# Altium schematic sheet 2.Microcontroller-NRF9160.SchDoc
size A2; DocumentNumber: 2; SheetNumber: 2
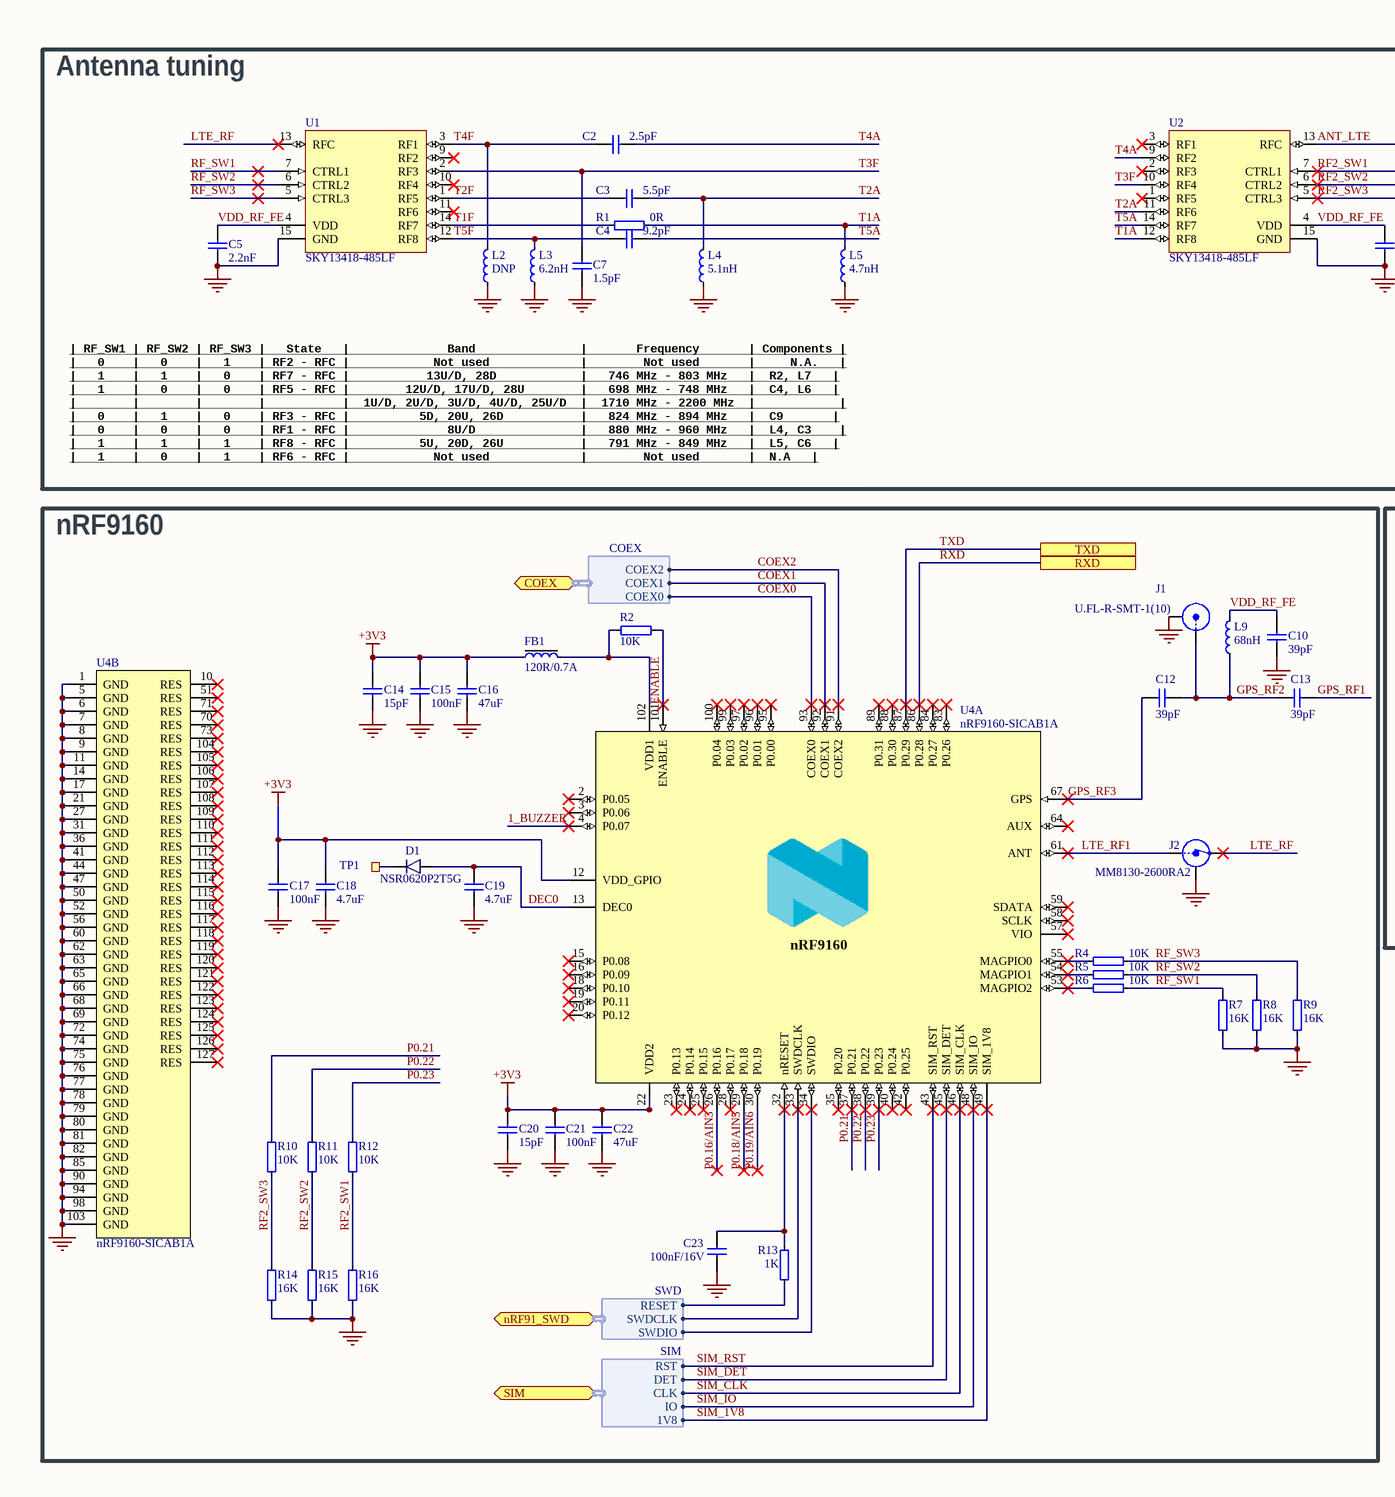
[diagram p0: 2.Microcontroller-NRF9160.SchDoc, left]
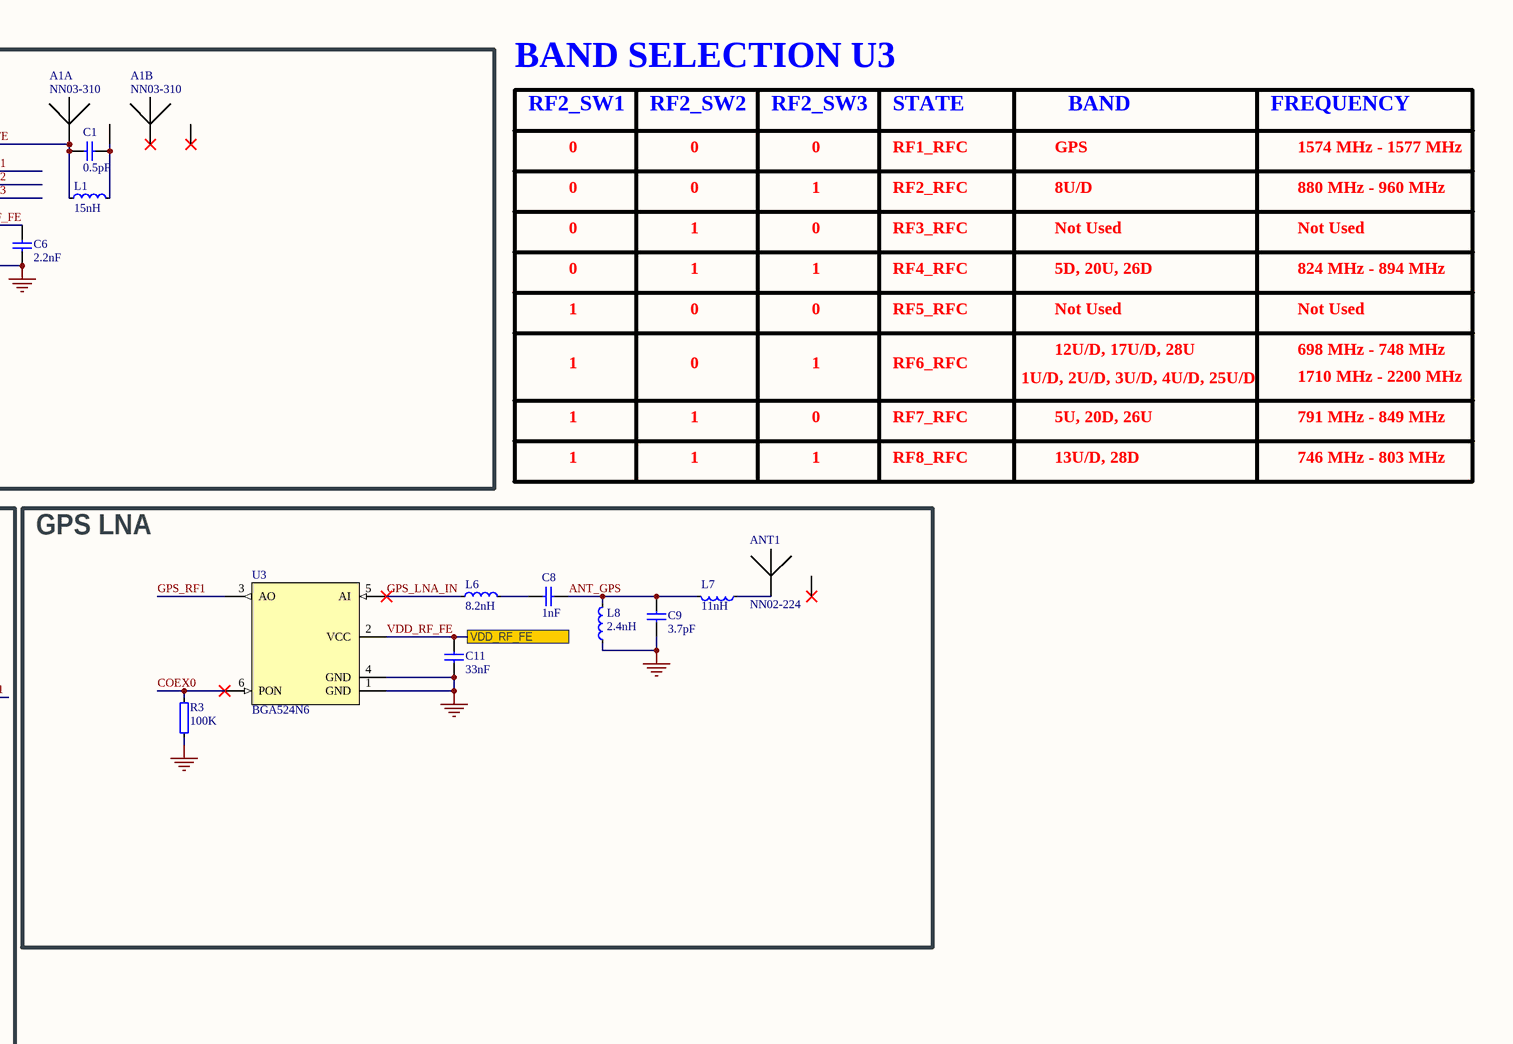
[diagram p1: 2.Microcontroller-NRF9160.SchDoc, right]

## Parts
A1  NN03-310  [FR01-S4-210_DF]  (parts A,B of 2)
ANT1  NN02-224  [ANT-NN02-224]
C1  0.5pF  [CAPC1005X04L]
C2  2.5pF  [CAPC0603X03L_C]
C3  5.5pF  [CAPC0603X03L_C]
C4  9.2pF  [CAPC0603X03L_C]
C5  2.2nF  [CAPC1005X04L]
C6  2.2nF  [CAPC1005X04L]
C7  1.5pF  [CAPC0603X03L_C]
C8  1nF  [CAPC1005X04L]
C9  3.7pF  [CAPC1005X04L]
C10  39pF  [CAPC1608X06L_3]
C11  33nF  [CAPC1005X04L]
C12  39pF  [CAPC1608X06L_3]
C13  39pF  [CAPC1608X06L_3]
C14  15pF  [CAPC1608X06L_3]
C15  100nF  [CAPC1608X06L_3]
C16  47uF  [CAPC2012X11L]
C17  100nF  [CAPC1608X06L_3]
C18  4.7uF  [CAPC1608X06L_3]
C19  4.7uF  [CAPC1608X06L_3]
C20  15pF  [CAPC1608X06L_3]
C21  100nF  [CAPC1608X06L_3]
C22  47uF  [CAPC2012X11L]
C23  100nF/16V  [CAPC1005X04L]
D1  NSR0620P2T5G  [SODFL100X40-2N]
FB1  120R/0.7A  [INDC1005X04L]
J1  U.FL-R-SMT-1(10)  [COAXIAL RF U.FL-R-SMT-1]
J2  MM8130-2600RA2  [COAXIAL-SWF]
L1  15nH  [INDC1608X06L_WW]
L2  DNP  [INDC0603X03L_C]
L3  6.2nH  [INDC0603X03L_C]
L4  5.1nH  [INDC0603X03L_C]
L5  4.7nH  [INDC0603X03L_C]
L6  8.2nH  [INDC1608X06L_WW]
L7  11nH  [INDC1608X06L]
L8  2.4nH  [INDC1005X04L_2]
L9  68nH  [INDC1005X04L_WW]
R1  0R  [RESC0603X03L_C]
R2  10K  [RESC1005X04L]
R3  100K  [RESC1005X04L]
R4  10K  [RESC1005X04L]
R5  10K  [RESC1005X04L]
R6  10K  [RESC1005X04L]
R7  16K  [RESC1005X04L]
R8  16K  [RESC1005X04L]
R9  16K  [RESC1005X04L]
R10  10K  [RESC1005X04L]
R11  10K  [RESC1005X04L]
R12  10K  [RESC1005X04L]
R13  1K  [RESC1005X04L]
R14  16K  [RESC1005X04L]
R15  16K  [RESC1005X04L]
R16  16K  [RESC1005X04L]
TP1  Ø1.0mm,SMD  [TP_SMD_Ø1.0mm]  (value not drawn)  (no BOM)
U1  SKY13418-485LF  [UFQFN40P200X200X65_HS-15N]
U2  SKY13418-485LF  [UFQFN40P200X200X65_HS-15N]
U3  BGA524N6  [XFDFN40P100X55-6N]
U4  nRF9160-SICAB1A  [LGA50P1600X1050X104-161N]  (parts A,B of 2)

## Blocks framed on the sheet
Antenna tuning: A1 C1-C7 L1-L5 R1 U1 U2
nRF9160: C10 C12-C23 D1 FB1 J1 J2 L9 R2 R4-R16 TP1 U4
GPS LNA: ANT1 C8 C9 C11 L6-L8 R3 U3

## Ports
COEX (bidir, harness COEX), nRF91_SWD (bidir, harness SWD), RXD, SIM (bidir, harness SIM), TXD, VDD_RF_FE

## Harnesses
SWD: SWDIO, SWDCLK, RESET
SIM: DET, RST, CLK, IO, 1V8
COEX: COEX2, COEX1, COEX0

## Nets
+3V3: C14.1 C15.1 C16.1 C17.1 C18.1 C20.1 C21.1 C22.1 FB1.1 U4.12(VDD_GPIO) U4.22(VDD2)
GND: C5.2 C6.2 C7.2 C9.2 C10.1 C11.1 C14.2 C15.2 C16.2 C17.2 C18.2 C19.2 C20.2 C21.2 C22.2 C23.2 J1.2(Y) J2.2(Shield) L2.1 L3.1 L4.1 L5.1 L8.1 R3.1 R7.1 R8.1 R9.1 R14.1 R15.1 R16.1 U1.15(GND) U2.15(GND) U3.1(GND) U3.4(GND) U4.1(GND) U4.5(GND) U4.6(GND) U4.7(GND) U4.8(GND) U4.9(GND) U4.11(GND) U4.14(GND) U4.17(GND) U4.21(GND) U4.27(GND) U4.31(GND) U4.36(GND) U4.41(GND) U4.44(GND) U4.47(GND) U4.50(GND) U4.52(GND) U4.56(GND) U4.60(GND) U4.62(GND) U4.63(GND) U4.65(GND) U4.66(GND) U4.68(GND) U4.69(GND) U4.72(GND) U4.74(GND) U4.75(GND) U4.76(GND) U4.77(GND) U4.78(GND) U4.79(GND) U4.80(GND) U4.81(GND) U4.82(GND) U4.85(GND) U4.90(GND) U4.94(GND) U4.98(GND) U4.103(GND)
1_BUZZER: U4.4(P0.07)
ANT_GPS: C8.2 C9.1 L7.2 L8.2
ANT_LTE: A1.1(Feed_A) C1.1 L1.1 U2.13(RFC)
COEX0: R3.2 U3.6(PON) U4.93(COEX0) ; port COEX.COEX0
COEX1: U4.92(COEX1) ; port COEX.COEX1
COEX2: U4.91(COEX2) ; port COEX.COEX2
DEC0: C19.1 D1.2(A) U4.13(DEC0)
ENABLE: R2.1 U4.101(ENABLE)
GPS_LNA_IN: L6.1 U3.5(AI)
GPS_RF1: C13.2 U3.3(AO)
GPS_RF2: C12.2 C13.1 J1.1(X) L9.2
GPS_RF3: C12.1 U4.67(GPS)
LTE_RF: J2.3(OUT) U1.13(RFC)
LTE_RF1: J2.1(IN) U4.61(ANT)
P0.16/AIN3: U4.26(P0.16)
P0.18/AIN5: U4.29(P0.18)
P0.19/AIN6: U4.30(P0.19)
P0.21: R10.2 U4.37(P0.21)
P0.22: R11.2 U4.38(P0.22)
P0.23: R12.2 U4.39(P0.23)
RF2_SW1: R12.1 R16.2 U2.7(CTRL1)
RF2_SW2: R11.1 R15.2 U2.6(CTRL2)
RF2_SW3: R10.1 R14.2 U2.5(CTRL3)
RF_SW1: R6.1 R7.2 U1.7(CTRL1)
RF_SW2: R5.1 R8.2 U1.6(CTRL2)
RF_SW3: R4.1 R9.2 U1.5(CTRL3)
RXD: U4.86(P0.28) ; port RXD
SIM_1V8: U4.49(SIM_1V8) ; port SIM.1V8
SIM_CLK: U4.46(SIM_CLK) ; port SIM.CLK
SIM_DET: U4.45(SIM_DET) ; port SIM.DET
SIM_IO: U4.48(SIM_IO) ; port SIM.IO
SIM_RST: U4.43(SIM_RST) ; port SIM.RST
T1A: L5.2 R1.1 U2.12(RF8)
T1F: R1.2 U1.14(RF7)
T2A: C3.1 L4.2 U2.11(RF6)
T2F: C3.2 U1.1(RF5)
T3F: C7.1 U1.2(RF3) U2.10(RF4)
T4A: C2.1 U2.9(RF2)
T4F: C2.2 L2.2 U1.3(RF1)
T5A: C4.1 U2.14(RF7)
T5F: C4.2 L3.2 U1.12(RF8)
TXD: U4.87(P0.29) ; port TXD
VDD_RF_FE: C5.1 C6.1 C10.2 C11.2 L9.1 U1.4(VDD) U2.4(VDD) U3.2(VCC) ; port VDD_RF_FE
NetA1_2: A1.2(Tuning_A) C1.2 L1.2
NetANT1_1: ANT1.1(Feed_A) L7.1
NetC8_1: C8.1 L6.2
NetC23_1: C23.1 R13.2 U4.32(nRESET)
NetD1_1: D1.1(C) TP1.1
NetFB1_2: FB1.2 R2.2 U4.102(VDD1)
NetR4_2: R4.2 U4.55(MAGPIO0)
NetR5_2: R5.2 U4.54(MAGPIO1)
NetR6_2: R6.2 U4.53(MAGPIO2)
NetR13_1: R13.1 ; port nRF91_SWD.RESET
NetU4_33: U4.33(SWDCLK) ; port nRF91_SWD.SWDCLK
NetU4_34: U4.34(SWDIO) ; port nRF91_SWD.SWDIO

Not connected (* = marked no-connect by the designer): A1 3(Feed_B)* 4(Tuning_B)*; ANT1 2(NC)*; U1 8(NC) 9(RF2)* 10(RF4)* 11(RF6)*; U2 1(RF5)* 2(RF3)* 3(RF1)* 8(NC); U4 2(P0.05)* 3(P0.06)* 10(RES)* 15(P0.08)* 16(P0.09)* 18(P0.10)* 19(P0.11)* 20(P0.12)* 23(P0.13)* 24(P0.14)* 25(P0.15)* 28(P0.17)* 35(P0.20)* 40(P0.24)* 42(P0.25)* 51(RES)* 57(VIO)* 58(SCLK)* 59(SDATA)* 64(AUX)* 70(RES)* 71(RES)* 73(RES)* 83(P0.26)* 84(P0.27)* 88(P0.30)* 89(P0.31)* 95(P0.00)* 96(P0.01)* 97(P0.02)* 99(P0.03)* 100(P0.04)* 104(RES)* 105(RES)* 106(RES)* 107(RES)* 108(RES)* 109(RES)* 110(RES)* 111(RES)* 112(RES)* 113(RES)* 114(RES)* 115(RES)* 116(RES)* 117(RES)* 118(RES)* 119(RES)* 120(RES)* 121(RES)* 122(RES)* 123(RES)* 124(RES)* 125(RES)* 126(RES)* 127(RES)*

## Notes on the sheet
- BAND SELECTION U3
- RF2_SW1
- 0
- RF2_SW2
- RF2_SW3
- STATE
- RF1_RFC
- GPS
- BAND
- FREQUENCY
- 1574 MHz - 1577 MHz
- 1
- RF2_RFC
- 8U/D
- 880 MHz - 960 MHz
- RF3_RFC
- RF4_RFC
- Not Used
- 5D, 20U, 26D
- 824 MHz - 894 MHz
- RF5_RFC
- RF6_RFC
- RF7_RFC
- 1U/D, 2U/D, 3U/D, 4U/D, 25U/D
- 12U/D, 17U/D, 28U
- 5U, 20D, 26U
- 698 MHz - 748 MHz
- 1710 MHz - 2200 MHz
- 791 MHz - 849 MHz
- | RF_SW1 | RF_SW2 | RF_SW3 |   State   |              Band               |       Frequency       | Components |
  |   0    |   0    |   1    | RF2 - RFC |            Not used             |        Not used       |     N.A.   |
  |   1    |   1    |   0    | RF7 - RFC |           13U/D, 28D            |   746 MHz - 803 MHz   |  R2, L7   |
  |   1    |   0    |   0    | RF5 - RFC |        12U/D, 17U/D, 28U        |   698 MHz - 748 MHz   |  C4, L6   |
  |        |        |        |           |  1U/D, 2U/D, 3U/D, 4U/D, 25U/D  |  1710 MHz - 2200 MHz  |            |
  |   0    |   1    |   0    | RF3 - RFC |          5D, 20U, 26D           |   824 MHz - 894 MHz   |  C9       |
  |   0    |   0    |   0    | RF1 - RFC |              8U/D               |   880 MHz - 960 MHz   |  L4, C3    |
  |   1    |   1    |   1    | RF8 - RFC |          5U, 20D, 26U           |   791 MHz - 849 MHz   |  L5, C6   |
  |   1    |   0    |   1    | RF6 - RFC |            Not used             |        Not used       |  N.A   |
- RF8_RFC
- 13U/D, 28D
- 746 MHz - 803 MHz
- (in symbol nRF9160-SICAB1A, part A) nRF9160

## Library data of the parts
A1 = FR01-S4-210-D: Mobile IoT LTE Multi-Band Antenna; ComponentLink1URL: https://www.fractusantennas.com/wp-content/uploads/2018/01/DS_FR01-S4-210.pdf; ComponentLink1Description: Datasheet; ComponentLink2URL: https://www.fractusantennas.com/trio-mxtend-mobile-iot-antenna/; ComponentLink2Description: Supplier link; Digikey Part Number: 2115-NN03-310CT-ND; LCSC: Non Stock
C1 = C0402-0.5p-HQ-Murata: Capacitor, NP0, ±0.05pF, 50V; ComponentLink1URL: https://search.murata.co.jp/Ceramy/image/img/A01X/G101/ENG/GJM1555C1HR50WB01-01.pdf; ComponentLink1Description: Datasheet; ComponentLink2URL: N.A.; ComponentLink2Description: Supplier link; Package: 0402; LCSC: C76912
C2-C4 C7 = C0201-5.5p-HQ-Murata: Capacitor, NP0, ±0.05pF, 25V; ComponentLink1URL: N.A.; ComponentLink1Description: Datasheet; ComponentLink2URL: N.A.; ComponentLink2Description: Supplier link; Package: 0201
  C2: LCSC: C161422
  C3: LCSC: C2187712
  C4: LCSC: C3019008
  C7: LCSC: C565475
C5 C6 C8 C9 C11 C14 C15 C17-C21 C23 = C0201-15p: Capacitor, NP0, ±5%, 25V; ComponentLink1URL: N.A.; ComponentLink1Description: Datasheet; ComponentLink2URL: N.A.; ComponentLink2Description: Supplier link
  C5 C6: Package: 0402; LCSC: C576456
  C8: Package: 0402; LCSC: C524559
  C9: Package: 0402; LCSC: C1855290; Digikey Part Number: 490-GJM1555C1H3R7BB01DCT-ND
  C11: Package: 0402; LCSC: C301939
  C14 C20: Package: 0603; LCSC: C519451
  C15 C17 C21: Package: 0603; LCSC: C14663
  C18 C19: Package: 0603; LCSC: C2961288
  C23: Package: 0402; LCSC: C1525
C10 C12 C13 = C0201-39p: Capacitor, NP0, ±1%, 25V; ComponentLink1URL: N.A.; ComponentLink1Description: Datasheet; ComponentLink2URL: N.A.; ComponentLink2Description: Supplier link; Package: 0201; LCSC: C3034511
C16 C22 = C0805-47µ-10V: Capacitor, X5R, ±20%, 10V; ComponentLink1URL: https://search.murata.co.jp/Ceramy/image/img/A01X/G101/ENG/GRM21BR61A476ME15-01A.pdf; ComponentLink1Description: Datasheet; ComponentLink2URL: N.A.; ComponentLink2Description: Supplier link; LCSC: C124129; Package: 0805
D1 = NSR0620P2T5G: 20V schottky barrier diode, Vf 350 mV @ 100 mA, Ir 2.0 µA @ 10 V, If 500 mA; Manufacturer: ON Semiconductor; Part number IPS: 00000009952; Note: N.A.; Artikkelnr Noca: 10029169; Pad Count: 2; Part Number: NSR0620P2T5G; Manufacturer Part Number: NSR0620P2T5G; LatestRevisionDate: 2016-07-07; Published: 2016-07-07; Value: NSR0620P2T5G; Package: SOD-923; ComponentLink1URL: N.A.; ComponentLink1Description: Datasheet; ComponentLink2URL: N.A.; ComponentLink2Description: Supplier link; HelpURL: http://www.onsemi.com/pub_link/Collateral/NSR0620P2-D.PDF; Supplier 1: Digi-Key; Supplier Part Number 1: NSR0620P2T5GOSCT-ND; Supplier 2: N.A.; Supplier Part Number 2: N.A.; Component Class: Semiconductors; PartId: 101300131; LCSC: C91106
FB1 = FB0402-120R@100M-700mA: Ferrite Bead, 120 Ohm @ 100MHz, 700mA, 130 mOhm Max; Manufacturer: Murata; Manufacturer Part Number: BLM15AX121SN1; Part number IPS: 00000004487; Note: N.A.; Pad Count: 2; Part Number: FB0402-120R@100M-700mA; ComponentLink1URL: https://www.murata.com/en-us/products/productdata/8796740059166/ENFA0018.pdf; ComponentLink1Description: Datasheet; ComponentLink2URL: N.A.; ComponentLink2Description: Supplier link; HelpURL: https://www.murata.com/products/productdetail?partno=BLM15AX121SN1%23; Package: 0402; LatestRevisionDate: 2020-04-28; Published: 2020-04-28; Value: 120R/0.7A; Artikkelnr Noca: N.A.; Supplier 1: Digi-Key; Supplier Part Number 1: 490-5439-1-ND; Supplier 2: N.A.; Supplier Part Number 2: N.A.; Component Class: Inductors; PartId: 100300100; LCSC: C337873
J1 = 20279-001E-03: Ultraminiature Coaxial Connector, 50 Ohm, SMD; ComponentLink1URL: \\hizz\pro\app9717\Datasheet\connectors\Wellshow\20279C18.pdf; ComponentLink1Description: Datasheet; ComponentLink2URL: N.A.; ComponentLink2Description: Supplier link; LCSC: NILL; Digikey Part Number: H11891CT-ND
J2 = MM8130-2600: Coaxial Connector with Switch; ComponentLink1URL: N.A.; ComponentLink1Description: Datasheet; ComponentLink2URL: N.A.; ComponentLink2Description: Supplier link; LCSC: C167503
L1 = L0603-15n-Wirewound-Murata: Inductor, 700mA, ±5%, 85mΩ, Q=42 @ 250MHz; ComponentLink1URL: https://search.murata.co.jp/Ceramy/image/img/P02/JELF243A-0026.pdf; ComponentLink1Description: Datasheet; ComponentLink2Description: Supplier link; Package: 0603; ComponentLink2URL: N.A.; LCSC: C341693
L2-L5 L7 L8 = L0201-6n2-Wirewound-Murata: Inductor, 360mA, ±5%, 220mOhm, Q=39; ComponentLink1URL: https://search.murata.co.jp/Ceramy/image/img/P02/JELF243A-0109.pdf; ComponentLink1Description: Datasheet; ComponentLink2Description: Supplier link; ComponentLink2URL: N.A.
  L2: Package: 0201; LCSC: NILL
  L3: Package: 0201; LCSC: C142508
  L4: Package: 0201; LCSC: C162624
  L5: Package: 0201; LCSC: C237443
  L7: Package: 0603; Digikey Part Number: 490-LQW18AN11NG80DCT-ND; LCSC: Non Stock
  L8: Package: 0402; LCSC: C412266
L6 = L0603-8n2-Wirewound-Murata: Inductor, 800mA, ±0.5nH, 58mΩ, Q=38 @ 250MHz; Manufacturer: Murata; Manufacturer Part Number: LQW18AN8N2D10; Part number IPS: 00000003972; Note: -55°C ~ 125°C; Artikkelnr Noca: N.A.; Pad Count: 2; Part Number: L0603-8n2-Wirewound-Murata; ComponentLink1URL: https://search.murata.co.jp/Ceramy/image/img/P02/JELF243A-0026.pdf; ComponentLink1Description: Datasheet; ComponentLink2Description: Supplier link; HelpURL: https://psearch.en.murata.com/inductor/product/LQW18AN8N2D10%23.html; Package: 0603; LatestRevisionDate: 2019-10-25; Published: 2019-10-25; Value: 8.2nH; ComponentLink2URL: N.A.; Supplier 1: Digi-Key; Supplier Part Number 1: 490-6914-1-ND; Supplier 2: N.A.; Supplier Part Number 2: N.A.; Component Class: Inductors; PartId: 100300394; LCSC: C98087
L9 = L0402-68n-Wirewound-Murata: Inductor, 140mA, ±2%, 1960mΩ, Q=20; ComponentLink1URL: https://search.murata.co.jp/Ceramy/image/img/P02/JELF243A-0050.pdf; ComponentLink1Description: Datasheet; ComponentLink2URL: N.A.; ComponentLink2Description: Supplier link; LCSC: C108965; Package: 0402
R1 = R0201-0R: Resistor, ±5%, 0.05W; ComponentLink1URL: N.A.; ComponentLink1Description: Datasheet; ComponentLink2URL: N.A.; ComponentLink2Description: Supplier link; Package: 0201; LCSC: C716999
R2-R16 = R0201-10k: Resistor, ±1%, 0.05W; ComponentLink1URL: N.A.; ComponentLink1Description: Datasheet; ComponentLink2URL: N.A.; ComponentLink2Description: Supplier link; Package: 0402
  R2 R4-R6 R10-R12: LCSC: C25744
  R3: LCSC: C25741
  R7-R9 R14-R16: LCSC: C160493
  R13: LCSC: C11702
TP1 = TP_SMD_Ø1.0MM: 1.0mm circular SMD testpad; Manufacturer: Nordic Semiconductor; Manufacturer Part Number: N.A.; Pad Count: 1; Part Number: TP_SMD_Ø1.0MM; Footprint Doc: TP_SMD_Ø1.0mm; LatestRevisionDate: 2013-06-11; Published: 2013-06-11; Value: Ø1.0mm,SMD; Note: N.A.; Artikkelnr Noca: N.A.; Part number IPS: N.A.; ComponentLink1URL: N.A.; ComponentLink1Description: Datasheet; ComponentLink2URL: N.A.; ComponentLink2Description: Supplier link; HelpURL: N.A.; Supplier 1: N.A.; Supplier Part Number 1: N.A.; Supplier 2: N.A.; Supplier Part Number 2: N.A.; Component Class: Connectors; PartId: 100500475
U1 U2 = QM12038: SP8T Switch For 3G/4G Applications; ComponentLink1URL: \\hizz\pro\app9717\Datasheet\integated circuits\qorvo\QM12038 Datasheet.pdf; ComponentLink1Description: Datasheet; ComponentLink2Description: Supplier link; LCSC: C150871; Package: QFN-14; ComponentLink2URL: N.A.
U3 = BGA524N6E6327XTSA1: GPS/GNSS Low-Noise Amplifier, 19.6dB Gain, 0.55dB Noise Figure, 1.5V to 3.3V Supply Range; Manufacturer: Infineon Technologies; Part number IPS: 00000004011; Note: N.A.; Pad Count: 6; Manufacturer Part Number: BGA524N6E6327XTSA1; Package: XFDFN-6; Value: BGA524N6; ComponentLink1URL: https://www.infineon.com/dgdl/Infineon-BGA524N6-DS-v03_00-en.pdf?fileId=db3a304344e406b50144e44dfad302b9; ComponentLink1Description: Datasheet; ComponentLink2URL: N.A.; ComponentLink2Description: Supplier link; HelpURL: https://www.infineon.com/cms/en/product/rf-wireless-control/low-noise-amplifier-lna-ics/gps-glonass-compass-lna/bga524n6/; LatestRevisionDate: 2019-10-25; Published: 2019-10-25; Supplier Part Number 1: BGA524N6E6327XTSA1CT-ND; Supplier Part Number 2: 726-A524N6E6327XTSA1; Component Class: Misc_ICs; PartId: 101900596; Digikey Part Number: BGA524N6E6327XTSA1CT-ND; LCSC: C534158
U4 = nRF9160-SICAB1A: Low power System-in-Package with integrated LTE-M/NB-IoT modem and GPS; Manufacturer: Nordic Semiconductor; Part number IPS: 80000002329; Note: N.A.; Pad Count: 161; Part Number: nRF9160-SICAB1A; Manufacturer Part Number: nRF9160-SICAB1A; Footprint Doc: LGA-161; Value: nRF9160-SICAB1A; ComponentLink1URL: N.A.; ComponentLink1Description: Datasheet; ComponentLink2URL: N.A.; ComponentLink2Description: Supplier link; HelpURL: N.A.; LatestRevisionDate: 2020-08-13; Published: 2020-08-13; Supplier 1: Nordic Semiconductor; Supplier Part Number 1: nRF9160-SICAB1A; Supplier 2: N.A.; Supplier Part Number 2: N.A.; Artikkelnr Noca: N.A.; Component Class: nRF_Devices; PartId: 102000165; Digikey Part Number: 4823-NRF9160-SICA-B1A-RCT-ND; LCSC: NILL
ANT1 = NN02-224: Digikey Part Number: 2115-NN02-224CT-ND; LCSC: Non Stock